# Altium schematic sheet 01 Revision History.SchDoc
size A4; Revision: V1.2; SheetNumber: 1; SheetTotal: 11
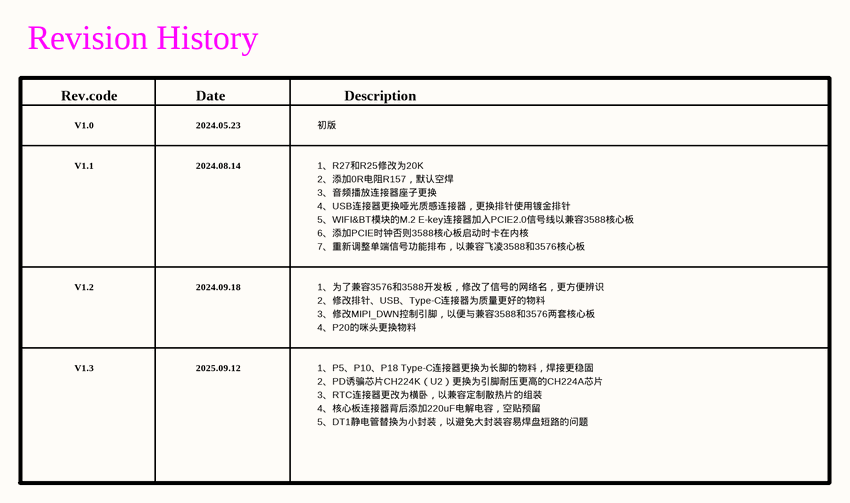
[diagram p0: 01 Revision History.SchDoc]

## Notes on the sheet
- Revision History
- Rev.code
- Date
- Description
- V1.0
- V1.1
- 2024.05.23
- 2024.08.14
- 初版
- 1、R27和R25修改为20K
- 2、添加0R电阻R157，默认空焊
- 4、USB连接器更换哑光质感连接器，更换排针使用镀金排针
- 3、音频播放连接器座子更换
- 5、WIFI&BT模块的M.2 E-key连接器加入PCIE2.0信号线以兼容3588核心板
- 6、添加PCIE时钟否则3588核心板启动时卡在内核
- V1.2
- 2024.09.18
- 7、重新调整单端信号功能排布，以兼容飞凌3588和3576核心板
- 1、为了兼容3576和3588开发板，修改了信号的网络名，更方便辨识
- 2、修改排针、USB、Type-C连接器为质量更好的物料
- V1.3
- 2025.09.12
- 3、修改MIPI_DWN控制引脚，以便与兼容3588和3576两套核心板
- 4、P20的咪头更换物料
- 1、P5、P10、P18 Type-C连接器更换为长脚的物料，焊接更稳固
- 2、PD诱骗芯片CH224K（U2）更换为引脚耐压更高的CH224A芯片
- 5、DT1静电管替换为小封装，以避免大封装容易焊盘短路的问题
- 4、核心板连接器背后添加220uF电解电容，空贴预留
- 3、RTC连接器更改为横卧，以兼容定制散热片的组装
- 设计
- 审核
- 工艺
- 图纸名称
- 夏鑫宇
- 批准
- 标准化
- 日期
- 版本
- 页码
- 第
- 页
- 共